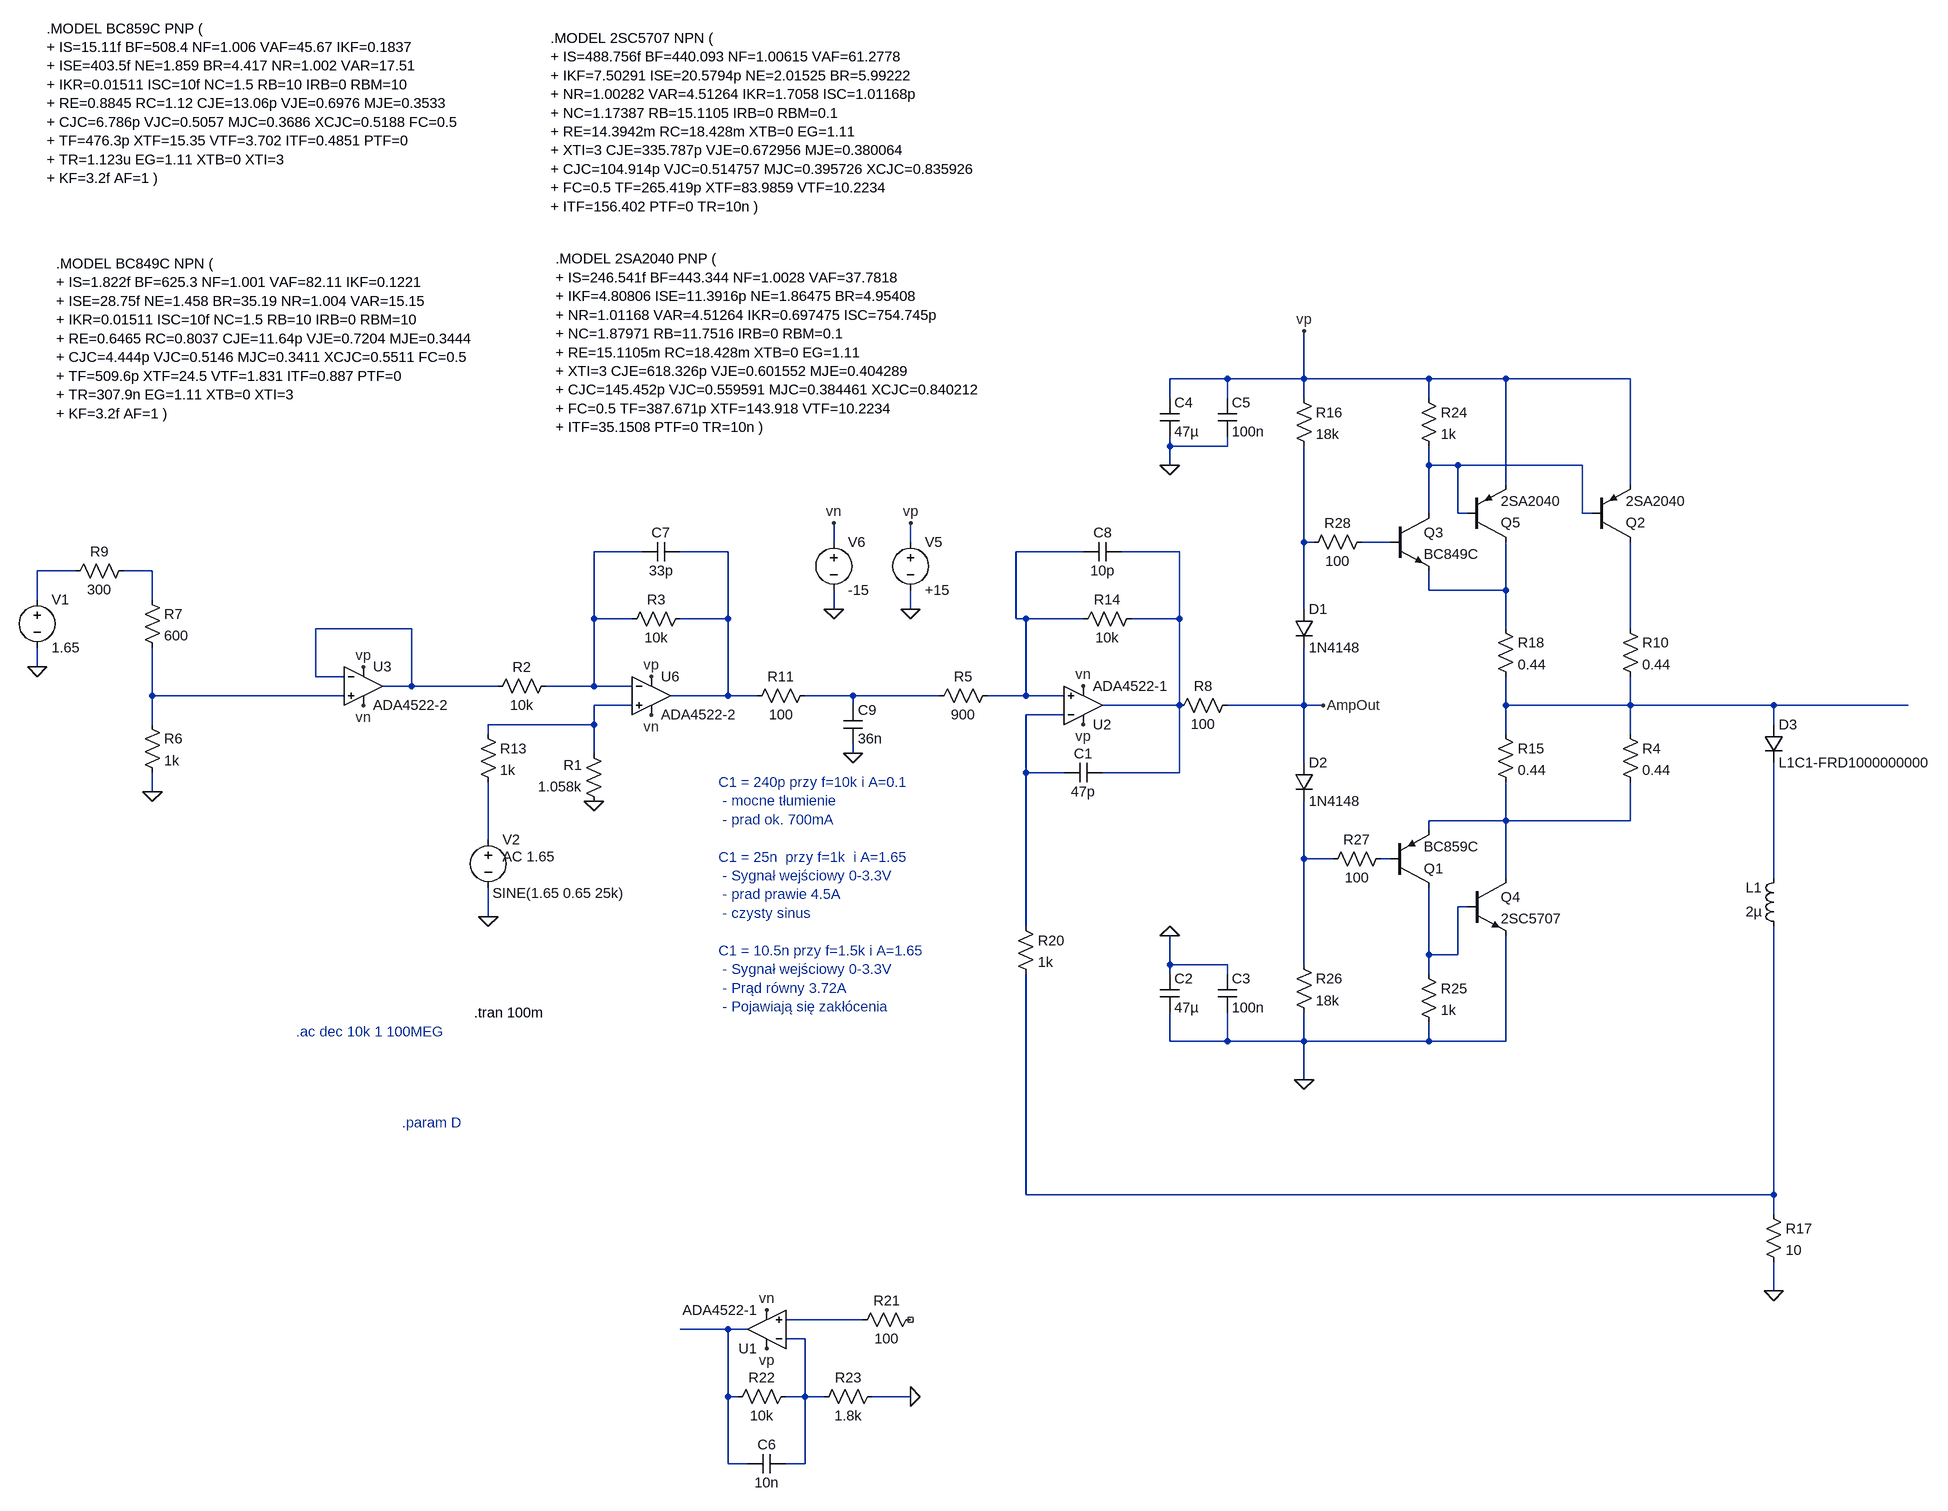
[diagram p0: schematic Laser.asc]
Laser.asc, the LTspice schematic file:
Version 4.1
SHEET 1 3148 1552
WIRE 1392 -400 1296 -400
WIRE 1520 -400 1520 -480
WIRE 1520 -400 1392 -400
WIRE 1728 -400 1520 -400
WIRE 1856 -400 1728 -400
WIRE 2064 -400 1856 -400
WIRE 1296 -368 1296 -400
WIRE 1392 -368 1392 -400
WIRE 1520 -368 1520 -400
WIRE 1728 -368 1728 -400
WIRE 1296 -288 1296 -304
WIRE 1392 -288 1392 -304
WIRE 1392 -288 1296 -288
WIRE 1296 -256 1296 -288
WIRE 1728 -256 1728 -288
WIRE 1776 -256 1728 -256
WIRE 1984 -256 1776 -256
WIRE 1856 -224 1856 -400
WIRE 2064 -224 2064 -400
WIRE 1728 -176 1728 -256
WIRE 1776 -176 1776 -256
WIRE 1792 -176 1776 -176
WIRE 1984 -176 1984 -256
WIRE 2000 -176 1984 -176
WIRE 736 -128 736 -160
WIRE 864 -128 864 -160
WIRE 1520 -128 1520 -288
WIRE 1536 -128 1520 -128
WIRE 1664 -128 1616 -128
WIRE 416 -112 336 -112
WIRE 560 -112 480 -112
WIRE 1152 -112 1040 -112
WIRE 1312 -112 1216 -112
WIRE -528 -80 -592 -80
WIRE -400 -80 -448 -80
WIRE 1728 -48 1728 -80
WIRE 1856 -48 1856 -128
WIRE 1856 -48 1728 -48
WIRE -592 -32 -592 -80
WIRE -400 -32 -400 -80
WIRE 736 -16 736 -48
WIRE 864 -16 864 -48
WIRE 1520 -16 1520 -128
WIRE 336 0 336 -112
WIRE 400 0 336 0
WIRE 560 0 560 -112
WIRE 560 0 480 0
WIRE 1040 0 1040 -112
WIRE 1056 0 1040 0
WIRE 1152 0 1056 0
WIRE 1312 0 1312 -112
WIRE 1312 0 1232 0
WIRE 32 16 -128 16
WIRE 1856 16 1856 -48
WIRE 2064 16 2064 -128
WIRE -592 80 -592 48
WIRE -128 96 -128 16
WIRE -80 96 -128 96
WIRE 32 112 32 16
WIRE 32 112 -16 112
WIRE 176 112 32 112
WIRE 336 112 336 0
WIRE 336 112 256 112
WIRE 400 112 336 112
WIRE -400 128 -400 48
WIRE -80 128 -400 128
WIRE 560 128 560 0
WIRE 560 128 464 128
WIRE 608 128 560 128
WIRE 768 128 688 128
WIRE 912 128 768 128
WIRE 1056 128 1056 0
WIRE 1056 128 992 128
WIRE 1120 128 1056 128
WIRE 400 144 336 144
WIRE 768 144 768 128
WIRE 1312 144 1312 0
WIRE 1312 144 1184 144
WIRE 1520 144 1520 48
WIRE 1520 144 1392 144
WIRE 1552 144 1520 144
WIRE 1856 144 1856 96
WIRE 2064 144 2064 96
WIRE 2064 144 1856 144
WIRE 2608 144 2064 144
WIRE 2832 144 2608 144
WIRE 1120 160 1056 160
WIRE -400 176 -400 128
WIRE 336 176 336 144
WIRE 336 176 160 176
WIRE 2608 176 2608 144
WIRE 160 192 160 176
WIRE 1856 192 1856 144
WIRE 2064 192 2064 144
WIRE 336 224 336 176
WIRE 768 224 768 208
WIRE 1520 240 1520 144
WIRE 1056 256 1056 160
WIRE 1120 256 1056 256
WIRE 1312 256 1312 144
WIRE 1312 256 1184 256
WIRE -400 288 -400 256
WIRE 1856 336 1856 272
WIRE 1856 336 1728 336
WIRE 2064 336 2064 272
WIRE 2064 336 1856 336
WIRE 1728 352 1728 336
WIRE 160 368 160 272
WIRE 1520 400 1520 304
WIRE 1568 400 1520 400
WIRE 1664 400 1648 400
WIRE 1856 432 1856 336
WIRE 2608 432 2608 240
WIRE 1792 480 1776 480
WIRE 160 496 160 448
WIRE 1056 512 1056 256
WIRE 1728 560 1728 448
WIRE 1776 560 1776 480
WIRE 1776 560 1728 560
WIRE 1296 576 1296 528
WIRE 1392 576 1296 576
WIRE 1520 576 1520 400
WIRE 1296 592 1296 576
WIRE 1392 592 1392 576
WIRE 1728 592 1728 560
WIRE 1296 704 1296 656
WIRE 1392 704 1392 656
WIRE 1392 704 1296 704
WIRE 1520 704 1520 656
WIRE 1520 704 1392 704
WIRE 1728 704 1728 672
WIRE 1728 704 1520 704
WIRE 1856 704 1856 528
WIRE 1856 704 1728 704
WIRE 1520 768 1520 704
WIRE 1056 960 1056 592
WIRE 2608 960 2608 512
WIRE 2608 960 1056 960
WIRE 2608 992 2608 960
WIRE 2608 1120 2608 1072
WIRE 784 1168 656 1168
WIRE 560 1184 480 1184
WIRE 592 1184 560 1184
WIRE 688 1200 656 1200
WIRE 560 1296 560 1184
WIRE 576 1296 560 1296
WIRE 688 1296 688 1200
WIRE 688 1296 656 1296
WIRE 720 1296 688 1296
WIRE 864 1296 800 1296
WIRE 560 1408 560 1296
WIRE 592 1408 560 1408
WIRE 688 1408 688 1296
WIRE 688 1408 656 1408
FLAG 864 -160 vp
FLAG 1296 528 0
FLAG 1296 -256 0
FLAG 2608 1120 0
FLAG 736 -160 vn
FLAG 864 -16 0
FLAG 736 -16 0
FLAG 1152 112 vn
FLAG 1152 176 vp
FLAG 624 1152 vn
FLAG 624 1216 vp
FLAG 1520 -480 vp
FLAG 432 160 vn
FLAG 432 96 vp
FLAG 160 496 0
FLAG -400 288 0
FLAG -592 80 0
FLAG 1552 144 AmpOut
FLAG 864 1296 0
FLAG -48 144 vn
FLAG -48 80 vp
FLAG 1520 768 0
FLAG 336 304 0
FLAG 768 224 0
SYMBOL voltage 864 -144 R0
WINDOW 123 0 0 Left 0
WINDOW 39 0 0 Left 0
SYMATTR InstName V5
SYMATTR Value +15
SYMBOL voltage 736 -144 R0
WINDOW 123 0 0 Left 0
WINDOW 39 0 0 Left 0
SYMATTR InstName V6
SYMATTR Value -15
SYMBOL res 1248 -16 R90
WINDOW 0 0 56 VBottom 2
WINDOW 3 32 56 VTop 2
SYMATTR InstName R14
SYMATTR Value 10k
SYMBOL cap 1184 240 R90
WINDOW 0 0 32 VBottom 2
WINDOW 3 32 32 VTop 2
SYMATTR InstName C1
SYMATTR Value 47p
SYMBOL res 1840 176 R0
SYMATTR InstName R15
SYMATTR Value 0.44
SYMBOL cap 1280 592 R0
SYMATTR InstName C2
SYMATTR Value 47µ
SYMBOL cap 1376 592 R0
SYMATTR InstName C3
SYMATTR Value 100n
SYMBOL cap 1280 -368 R0
SYMATTR InstName C4
SYMATTR Value 47µ
SYMBOL cap 1376 -368 R0
SYMATTR InstName C5
SYMATTR Value 100n
SYMBOL res 1504 -384 R0
SYMATTR InstName R16
SYMATTR Value 18k
SYMBOL res 2592 976 R0
SYMATTR InstName R17
SYMATTR Value 10
SYMBOL res 1840 0 R0
SYMATTR InstName R18
SYMATTR Value 0.44
SYMBOL diode 1504 -16 R0
SYMATTR InstName D1
SYMATTR Value 1N4148
SYMBOL res 1040 496 R0
SYMATTR InstName R20
SYMATTR Value 1k
SYMBOL res 880 1152 R90
WINDOW 0 0 56 VBottom 2
WINDOW 3 32 56 VTop 2
SYMATTR InstName R21
SYMATTR Value 100
SYMBOL res 672 1280 R90
WINDOW 0 0 56 VBottom 2
WINDOW 3 32 56 VTop 2
SYMATTR InstName R22
SYMATTR Value 10k
SYMBOL res 816 1280 R90
WINDOW 0 0 56 VBottom 2
WINDOW 3 32 56 VTop 2
SYMATTR InstName R23
SYMATTR Value 1.8k
SYMBOL diode 1504 240 R0
SYMATTR InstName D2
SYMATTR Value 1N4148
SYMBOL npn 1664 -176 R0
SYMATTR InstName Q3
SYMATTR Value BC849C
SYMBOL res 1712 -384 R0
SYMATTR InstName R24
SYMATTR Value 1k
SYMBOL res 1712 576 R0
SYMATTR InstName R25
SYMATTR Value 1k
SYMBOL res 1504 560 R0
SYMATTR InstName R26
SYMATTR Value 18k
SYMBOL res 1664 384 R90
WINDOW 0 0 56 VBottom 2
WINDOW 3 32 56 VTop 2
SYMATTR InstName R27
SYMATTR Value 100
SYMBOL res 1632 -144 R90
WINDOW 0 0 56 VBottom 2
WINDOW 3 32 56 VTop 2
SYMATTR InstName R28
SYMATTR Value 100
SYMBOL voltage 160 352 R0
WINDOW 123 24 44 Left 2
WINDOW 39 0 0 Left 0
WINDOW 3 7 105 Left 2
SYMATTR Value2 AC 1.65
SYMATTR Value SINE(1.65 0.65 25k)
SYMATTR InstName V2
SYMBOL res 496 -16 R90
WINDOW 0 0 56 VBottom 2
WINDOW 3 32 56 VTop 2
SYMATTR InstName R3
SYMATTR Value 10k
SYMBOL res 272 96 R90
WINDOW 0 0 56 VBottom 2
WINDOW 3 32 56 VTop 2
SYMATTR InstName R2
SYMATTR Value 10k
SYMBOL res -416 160 R0
SYMATTR InstName R6
SYMATTR Value 1k
SYMBOL res -416 -48 R0
SYMATTR InstName R7
SYMATTR Value 600
SYMBOL voltage -592 -48 R0
WINDOW 123 0 0 Left 0
WINDOW 39 0 0 Left 0
SYMATTR InstName V1
SYMATTR Value 1.65
SYMBOL cap 480 -128 R90
WINDOW 0 0 32 VBottom 2
WINDOW 3 32 32 VTop 2
SYMATTR InstName C7
SYMATTR Value 33p
SYMBOL res -432 -96 R90
WINDOW 0 0 56 VBottom 2
WINDOW 3 32 56 VTop 2
SYMATTR InstName R9
SYMATTR Value 300
SYMBOL cap 656 1392 R90
WINDOW 0 0 32 VBottom 2
WINDOW 3 32 32 VTop 2
SYMATTR InstName C6
SYMATTR Value 10n
SYMBOL pnp 1664 448 M180
SYMATTR InstName Q1
SYMATTR Value BC859C
SYMBOL pnp 2000 -128 M180
SYMATTR InstName Q2
SYMATTR Value 2SA2040
SYMBOL res 2048 0 R0
SYMATTR InstName R10
SYMATTR Value 0.44
SYMBOL res 144 176 R0
SYMATTR InstName R13
SYMATTR Value 1k
SYMBOL npn 1792 432 R0
SYMATTR InstName Q4
SYMATTR Value 2SC5707
SYMBOL OpAmps\\ADA4522-2 432 64 R0
SYMATTR InstName U6
SYMBOL OpAmps\\ADA4522-1 1152 208 M180
SYMATTR InstName U2
SYMBOL OpAmps\\ADA4522-2 -48 48 R0
SYMATTR InstName U3
SYMBOL OpAmps\\ADA4522-1 624 1248 R180
SYMATTR InstName U1
SYMBOL diode 2592 176 R0
SYMATTR InstName D3
SYMATTR Value L1C1-FRD1000000000
SYMATTR Description Diode
SYMATTR Type diode
SYMBOL res 352 320 R180
WINDOW 0 36 76 Left 2
WINDOW 3 36 40 Left 2
SYMATTR InstName R1
SYMATTR Value 1.058k
SYMBOL cap 1216 -128 R90
WINDOW 0 0 32 VBottom 2
WINDOW 3 32 32 VTop 2
SYMATTR InstName C8
SYMATTR Value 10p
SYMBOL res 2048 176 R0
SYMATTR InstName R4
SYMATTR Value 0.44
SYMBOL res 1008 112 R90
WINDOW 0 0 56 VBottom 2
WINDOW 3 32 56 VTop 2
SYMATTR InstName R5
SYMATTR Value 900
SYMBOL res 1408 128 R90
WINDOW 0 0 56 VBottom 2
WINDOW 3 32 56 VTop 2
SYMATTR InstName R8
SYMATTR Value 100
SYMBOL pnp 1792 -128 M180
SYMATTR InstName Q5
SYMATTR Value 2SA2040
SYMBOL res 704 112 R90
WINDOW 0 0 56 VBottom 2
WINDOW 3 32 56 VTop 2
SYMATTR InstName R11
SYMATTR Value 100
SYMBOL cap 752 144 R0
SYMATTR InstName C9
SYMATTR Value 36n
SYMBOL ind 2624 528 R180
WINDOW 0 36 80 Left 2
WINDOW 3 36 40 Left 2
SYMATTR InstName L1
SYMATTR Value 2µ
TEXT 136 656 Left 2 !.tran 100m
TEXT 16 840 Left 2 ;.param D
TEXT 544 272 Left 2 ;C1 = 240p przy f=10k i A=0.1\n - mocne tłumienie\n - prad ok. 700mA\n \nC1 = 25n  przy f=1k  i A=1.65\n - Sygnał wejściowy 0-3.3V \n - prad prawie 4.5A\n - czysty sinus\n \nC1 = 10.5n przy f=1.5k i A=1.65\n - Sygnał wejściowy 0-3.3V\n - Prąd równy 3.72A\n - Pojawiają się zakłócenia
TEXT -160 688 Left 2 ;.ac dec 10k 1 100MEG
TEXT 272 -600 Left 2 !.MODEL 2SA2040 PNP (\n+ IS=246.541f BF=443.344 NF=1.0028 VAF=37.7818\n+ IKF=4.80806 ISE=11.3916p NE=1.86475 BR=4.95408\n+ NR=1.01168 VAR=4.51264 IKR=0.697475 ISC=754.745p\n+ NC=1.87971 RB=11.7516 IRB=0 RBM=0.1\n+ RE=15.1105m RC=18.428m XTB=0 EG=1.11\n+ XTI=3 CJE=618.326p VJE=0.601552 MJE=0.404289\n+ CJC=145.452p VJC=0.559591 MJC=0.384461 XCJC=0.840212\n+ FC=0.5 TF=387.671p XTF=143.918 VTF=10.2234\n+ ITF=35.1508 PTF=0 TR=10n )
TEXT 264 -968 Left 2 !.MODEL 2SC5707 NPN (\n+ IS=488.756f BF=440.093 NF=1.00615 VAF=61.2778\n+ IKF=7.50291 ISE=20.5794p NE=2.01525 BR=5.99222\n+ NR=1.00282 VAR=4.51264 IKR=1.7058 ISC=1.01168p\n+ NC=1.17387 RB=15.1105 IRB=0 RBM=0.1\n+ RE=14.3942m RC=18.428m XTB=0 EG=1.11\n+ XTI=3 CJE=335.787p VJE=0.672956 MJE=0.380064\n+ CJC=104.914p VJC=0.514757 MJC=0.395726 XCJC=0.835926\n+ FC=0.5 TF=265.419p XTF=83.9859 VTF=10.2234\n+ ITF=156.402 PTF=0 TR=10n )
TEXT -576 -984 Left 2 !.MODEL BC859C PNP (\n+ IS=15.11f BF=508.4 NF=1.006 VAF=45.67 IKF=0.1837\n+ ISE=403.5f NE=1.859 BR=4.417 NR=1.002 VAR=17.51\n+ IKR=0.01511 ISC=10f NC=1.5 RB=10 IRB=0 RBM=10\n+ RE=0.8845 RC=1.12 CJE=13.06p VJE=0.6976 MJE=0.3533\n+ CJC=6.786p VJC=0.5057 MJC=0.3686 XCJC=0.5188 FC=0.5\n+ TF=476.3p XTF=15.35 VTF=3.702 ITF=0.4851 PTF=0\n+ TR=1.123u EG=1.11 XTB=0 XTI=3\n+ KF=3.2f AF=1 )
TEXT -560 -592 Left 2 !.MODEL BC849C NPN (\n+ IS=1.822f BF=625.3 NF=1.001 VAF=82.11 IKF=0.1221\n+ ISE=28.75f NE=1.458 BR=35.19 NR=1.004 VAR=15.15\n+ IKR=0.01511 ISC=10f NC=1.5 RB=10 IRB=0 RBM=10\n+ RE=0.6465 RC=0.8037 CJE=11.64p VJE=0.7204 MJE=0.3444\n+ CJC=4.444p VJC=0.5146 MJC=0.3411 XCJC=0.5511 FC=0.5\n+ TF=509.6p XTF=24.5 VTF=1.831 ITF=0.887 PTF=0\n+ TR=307.9n EG=1.11 XTB=0 XTI=3\n+ KF=3.2f AF=1 )

The netlist it stands for:
* Laser.asc
V5 vp 0 +15
V6 vn 0 -15
R14 N007 N006 10k
C1 N007 N017 47p
R15 N016 N018 0.44
C2 0 0 47µ
C3 0 0 100n
C4 vp 0 47µ
C5 vp 0 100n
R16 vp N002 18k
R17 N024 0 10
R18 N010 N016 0.44
D1 N002 AmpOut 1N4148
R20 N017 N024 1k
R21 NC_01 N025 100
R22 N027 N026 10k
R23 0 N027 1.8k
D2 AmpOut N020 1N4148
Q3 N001 N003 N010 0 BC849C
R24 vp N001 1k
R25 N023 0 1k
R26 N020 0 18k
R27 N021 N020 100
R28 N003 N002 100
V2 N019 0 SINE(1.65 0.65 25k) AC 1.65
R3 N005 N004 10k
R2 N004 N011 10k
R6 N013 0 1k
R7 N009 N013 600
V1 N008 0 1.65
C7 N005 N004 33p
R9 N009 N008 300
C6 N027 N026 10n
Q1 N023 N021 N018 0 BC859C
Q2 N012 N001 vp 0 2SA2040
R10 N012 N016 0.44
R13 N015 N019 1k
Q4 N018 N023 0 0 2SC5707
X§U6 N015 N004 vp vn N005 ADA4522  ; ADA4522-2, pins In+ In- V+ V- OUT
X§U2 N006 N017 vp vn N007 ADA4522-1  ; pins In+ In- V+ V- OUT
X§U3 N013 N011 vp vn N011 ADA4522  ; ADA4522-2, pins In+ In- V+ V- OUT
X§U1 N025 N027 vp vn N026 ADA4522-1  ; pins In+ In- V+ V- OUT
D3 N016 N022 L1C1-FRD1000000000
R1 0 N015 1.058k
C8 N007 N006 10p
R4 N016 N018 0.44
R5 N006 N014 900
R8 AmpOut N007 100
Q5 N010 N001 vp 0 2SA2040
R11 N014 N005 100
C9 N014 0 36n
L1 N024 N022 2µ
.model D D
.lib standard.dio
.model NPN NPN
.model PNP PNP
.lib standard.bjt
.tran 100m
* .param D
* C1 = 240p przy f=10k i A=0.1
*  - mocne tłumienie
*  - prad ok. 700mA
* C1 = 25n  przy f=1k  i A=1.65
*  - Sygnał wejściowy 0-3.3V
*  - prad prawie 4.5A
*  - czysty sinus
* C1 = 10.5n przy f=1.5k i A=1.65
*  - Sygnał wejściowy 0-3.3V
*  - Prąd równy 3.72A
*  - Pojawiają się zakłócenia
* .ac dec 10k 1 100MEG
.MODEL 2SA2040 PNP (
+ IS=246.541f BF=443.344 NF=1.0028 VAF=37.7818
+ IKF=4.80806 ISE=11.3916p NE=1.86475 BR=4.95408
+ NR=1.01168 VAR=4.51264 IKR=0.697475 ISC=754.745p
+ NC=1.87971 RB=11.7516 IRB=0 RBM=0.1
+ RE=15.1105m RC=18.428m XTB=0 EG=1.11
+ XTI=3 CJE=618.326p VJE=0.601552 MJE=0.404289
+ CJC=145.452p VJC=0.559591 MJC=0.384461 XCJC=0.840212
+ FC=0.5 TF=387.671p XTF=143.918 VTF=10.2234
+ ITF=35.1508 PTF=0 TR=10n )
.MODEL 2SC5707 NPN (
+ IS=488.756f BF=440.093 NF=1.00615 VAF=61.2778
+ IKF=7.50291 ISE=20.5794p NE=2.01525 BR=5.99222
+ NR=1.00282 VAR=4.51264 IKR=1.7058 ISC=1.01168p
+ NC=1.17387 RB=15.1105 IRB=0 RBM=0.1
+ RE=14.3942m RC=18.428m XTB=0 EG=1.11
+ XTI=3 CJE=335.787p VJE=0.672956 MJE=0.380064
+ CJC=104.914p VJC=0.514757 MJC=0.395726 XCJC=0.835926
+ FC=0.5 TF=265.419p XTF=83.9859 VTF=10.2234
+ ITF=156.402 PTF=0 TR=10n )
.MODEL BC859C PNP (
+ IS=15.11f BF=508.4 NF=1.006 VAF=45.67 IKF=0.1837
+ ISE=403.5f NE=1.859 BR=4.417 NR=1.002 VAR=17.51
+ IKR=0.01511 ISC=10f NC=1.5 RB=10 IRB=0 RBM=10
+ RE=0.8845 RC=1.12 CJE=13.06p VJE=0.6976 MJE=0.3533
+ CJC=6.786p VJC=0.5057 MJC=0.3686 XCJC=0.5188 FC=0.5
+ TF=476.3p XTF=15.35 VTF=3.702 ITF=0.4851 PTF=0
+ TR=1.123u EG=1.11 XTB=0 XTI=3
+ KF=3.2f AF=1 )
.MODEL BC849C NPN (
+ IS=1.822f BF=625.3 NF=1.001 VAF=82.11 IKF=0.1221
+ ISE=28.75f NE=1.458 BR=35.19 NR=1.004 VAR=15.15
+ IKR=0.01511 ISC=10f NC=1.5 RB=10 IRB=0 RBM=10
+ RE=0.6465 RC=0.8037 CJE=11.64p VJE=0.7204 MJE=0.3444
+ CJC=4.444p VJC=0.5146 MJC=0.3411 XCJC=0.5511 FC=0.5
+ TF=509.6p XTF=24.5 VTF=1.831 ITF=0.887 PTF=0
+ TR=307.9n EG=1.11 XTB=0 XTI=3
+ KF=3.2f AF=1 )
.lib ADA4522.lib
.backanno
.end